# EasyEDA Pro project ProPrj_轮腿机器人-世博同学-正式版.epro, board PCB_Encoder
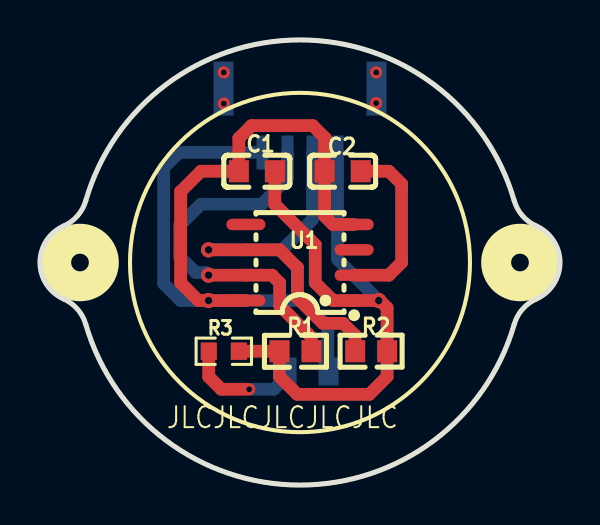
[diagram p5: board, top side]
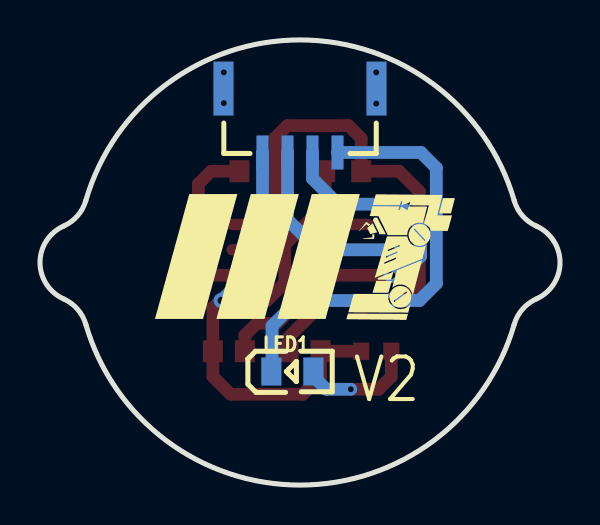
[diagram p6: board, bottom side, seen from below]

Outline 26 x 22.3 mm; copper layers: Top Layer, Bottom Layer. Coordinates in mm from the lower left corner of the outline.
Outline path: 1.18,9.32 arc(0,11.15) 1.18,12.98 arc(1.88,13.49) 2.29,14.25 arc(13,22.3) 23.71,14.25 arc(24.12,13.49) 24.82,12.98 arc(26,11.15) 24.82,9.32 arc(24.12,8.81) 23.71,8.05 arc(13,0) 2.29,8.05 arc(1.88,8.81) 1.18,9.32
Stack: Top Layer 0.035mm / Dielectric1 1.51mm FR4 er 4.5 / Bottom Layer 0.035mm

## Design rules (mm)
spacing Default (default): track to track 0.152, other pairs 0 to 0.152
track width Default (default): min 0.254, default 0.254, max 25.4
differential pair differentialPair (default): width min 0.127, default 0.254, max 2.54; gap min 0.152, default 0.152
via Default (default): diameter min 0.61, default 0.61, max 100.025; hole min 0.305, default 0.305, max 59.995

## Placement (name value [footprint] x y rotation side)
C1  100nf  [C0603]  10.84 15.72 0 top
C2  1uf  [C0603]  15.13 15.72 0 top
J2  GH1.25_4P  [GH1.25_4P_卧贴]  13 18.26 0 bottom
LED1  NCD0805R1  [LED0805-R-RD]  13.38 5.69 180 bottom
R1  4.7K  [R0603#2]  12.77 6.7 180 top
R2  4.7K  [R0603#2]  16.56 6.7 0 top
R3  1kΩ  [R0603]  9.19 6.7 180 top
U1  AS5600-ASOM  [SOIC-8_L5.0-W4.0-P1.27-LS6.0-BL]  13 11.15 90 top

## Footprints (pads in the part's own frame, mm; a bottom-side part is the same pattern mirrored in y, then rotated)
C0603
  rect 1x1.1 smd: 1(-0.9,0) 2(0.9,0)
GH1.25_4P_卧贴
  rect 0.6x1.7 smd: 1(-1.875,1.6) 2(-0.625,1.6) 3(0.625,1.6) 4(1.875,1.6)
  rect 1x2.7 smd: 5(3.825,-1.6) 6(-3.825,-1.6)
LED0805-R-RD
  rect 1x1.399 smd: 1(1.05,0) 2(-1.05,0)
R0603
  rect 0.806x0.864 smd: 1(-0.753,0) 2(0.753,0)
R0603#2
  rect 1x1.1 smd: 1(-0.8,0) 2(0.8,0)
SOIC-8_L5.0-W4.0-P1.27-LS6.0-BL
  oval 0.569x1.95 smd: 1(-1.905,-2.705) 2(-0.635,-2.705) 3(0.635,-2.705) 4(1.905,-2.705) 5(1.905,2.705) 6(0.635,2.705) 7(-0.635,2.705) 8(-1.905,2.705)

## Nets
As in the schematic.

Pads without a net: J2 5 6; U1 3 5

## Via types
v1: diameter 0.61, hole 0.305, Top Layer to Bottom Layer, 5 vias
v2: diameter 0.762, hole 0.381, Top Layer to Bottom Layer, 4 vias

## Routing (per net, layer and track width the routed paths; a pad name or vN(x,y) marks a point on that pad's centre or on a via; arc(x,y) is an arc through that point)
GND: length 46.3
  Top Layer w0.635: U1.8 v2(8.43,9.24) 7.92,9.24 7.03,10.13 7.03,14.71 8.05,15.72 C1.1 9.94,17.37 10.58,18.01 13.64,18.01 14.27,17.37 14.23,17.33 C2.1 14.23,13.47 14.65,13.05 U1.4
  Bottom Layer w0.635: 11.13,16.66 6.96,16.66 6.18,15.89 6.18,10.09 7.03,9.24 v2(8.43,9.24) 13.13,9.24 14.4,7.97 14.4,5.47
VCC: length 31.7
  Top Layer w0.635: R3.1 R1.2 11.97,5.43 12.86,4.55 16.47,4.55 17.36,5.43 R2.2 17.36,8.88 16.99,9.24 v2(16.94,9.24) U1.1 14.65,9.24 13.76,10.13 13.76,12.04 11.74,14.06 C1.2
  Bottom Layer w0.635: 14.87,16.66 14.87,11.31 v2(16.94,9.24)
VCC3.3: length 8.9
  Top Layer w0.635: U1.2 17.45,10.51 18.08,11.15 18.08,15.09 17.45,15.72 16.03,15.72
(no net):
  vias: v1(9.19,20.67) v1(9.19,19.11) v1(16.81,20.67) v1(16.81,19.13)
SCL: length 18.9
  Top Layer w0.635: v2(8.43,10.51) U1.7 11.6,10.51 11.98,10.13 11.98,8.99 13.57,7.4 R1.1
  Bottom Layer w0.635: J2.2 12.38,15.35 11.1,14.07 8.05,14.07 6.97,13 6.97,11.46 7.79,10.64 8.3,10.64 v2(8.43,10.51)
SDA: length 20
  Top Layer w0.635: R2.1 15.76,7.5 15.16,8.1 14.14,8.1 12.87,9.37 12.87,10.9 11.98,11.78 U1.6 v2(8.43,11.78)
  Bottom Layer w0.635: v2(8.43,11.78) 12.11,11.78 13.63,13.3 J2.3
$1N565: length 5.8
  Top Layer w0.635: 10.33,4.8 9.06,4.8 8.44,5.43 R3.2
  Bottom Layer w0.635: LED1.1 12.33,5.44 11.69,4.8 v1(10.46,4.8)

## Text on the board
Bottom Silkscreen Layer: V2
Top Silkscreen Layer: JLCJLCJLCJLCJLC
